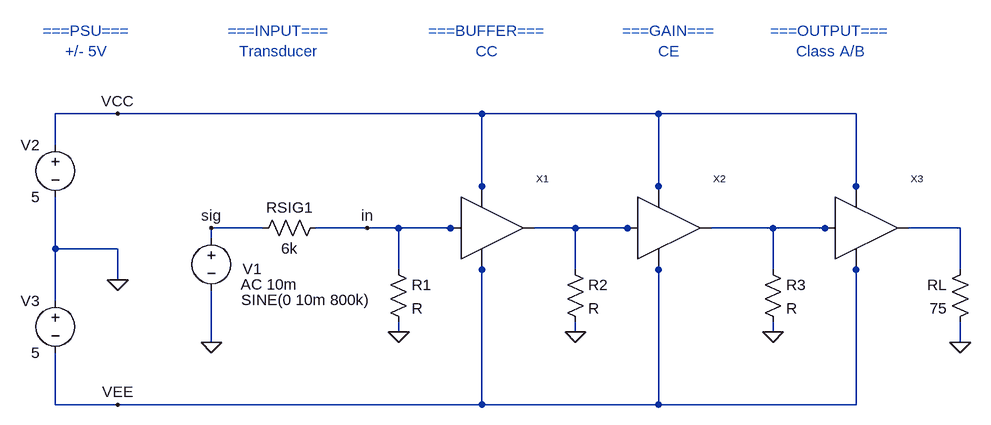
[diagram p0: schematic Lab 7 Amplifer Blocks.asc]
Lab 7 Amplifer Blocks.asc, the LTspice schematic file:
Version 4.1
SHEET 1 1372 680
WIRE -800 80 -896 80
WIRE -240 80 -800 80
WIRE 32 80 -240 80
WIRE 336 80 32 80
WIRE -896 128 -896 80
WIRE -240 192 -240 80
WIRE 32 192 32 80
WIRE 336 192 336 80
WIRE -576 256 -656 256
WIRE -416 256 -496 256
WIRE -368 256 -416 256
WIRE -288 256 -368 256
WIRE -96 256 -160 256
WIRE -16 256 -96 256
WIRE 208 256 112 256
WIRE 288 256 208 256
WIRE 496 256 416 256
WIRE -656 272 -656 256
WIRE -896 288 -896 208
WIRE -800 288 -896 288
WIRE -368 320 -368 256
WIRE -96 320 -96 256
WIRE 208 320 208 256
WIRE 496 320 496 256
WIRE -800 336 -800 288
WIRE -896 368 -896 288
WIRE -368 416 -368 400
WIRE -96 416 -96 400
WIRE 208 416 208 400
WIRE -656 432 -656 352
WIRE 496 432 496 400
WIRE -896 528 -896 448
WIRE -800 528 -896 528
WIRE -240 528 -240 320
WIRE -240 528 -800 528
WIRE 32 528 32 320
WIRE 32 528 -240 528
WIRE 336 528 336 320
WIRE 336 528 32 528
FLAG -656 432 0
FLAG -656 256 sig
FLAG -416 256 in
FLAG -368 416 0
FLAG -96 416 0
FLAG 208 416 0
FLAG 496 432 0
FLAG -800 336 0
FLAG -800 528 VEE
FLAG -800 80 VCC
SYMBOL voltage -656 256 R0
WINDOW 0 48 63 Left 2
WINDOW 3 46 111 Left 2
WINDOW 123 45 87 Left 2
WINDOW 39 0 0 Left 0
SYMATTR InstName V1
SYMATTR Value SINE(0 10m 800k)
SYMATTR Value2 AC 10m
SYMBOL res -480 240 R90
WINDOW 0 0 56 VBottom 2
WINDOW 3 32 56 VTop 2
SYMATTR InstName RSIG1
SYMATTR Value 6k
SYMBOL res -384 304 R0
SYMATTR InstName R1
SYMBOL Ideal\ Amp -272 256 R0
SYMATTR InstName X1
SYMBOL res -112 304 R0
SYMATTR InstName R2
SYMBOL Ideal\ Amp 0 256 R0
SYMATTR InstName X2
SYMBOL res 192 304 R0
SYMATTR InstName R3
SYMBOL Ideal\ Amp 304 256 R0
SYMATTR InstName X3
SYMBOL res 512 304 M0
SYMATTR InstName RL
SYMATTR Value 75
SYMBOL voltage -896 112 M0
WINDOW 123 0 0 Left 0
WINDOW 39 0 0 Left 0
SYMATTR InstName V2
SYMATTR Value 5
SYMBOL voltage -896 352 M0
WINDOW 123 0 0 Left 0
WINDOW 39 0 0 Left 0
SYMATTR InstName V3
SYMATTR Value 5
TEXT 296 -32 Center 2 ;===OUTPUT===\nClass A/B
TEXT 48 -32 Center 2 ;===GAIN===\nCE
TEXT -232 -32 Center 2 ;===BUFFER===\nCC
TEXT -552 -32 Center 2 ;===INPUT===\nTransducer
TEXT -848 -32 Center 2 ;===PSU===\n+/- 5V

The netlist it stands for:
* Lab 7 Amplifer Blocks.asc
V1 sig 0 SINE(0 10m 800k) AC 10m
RSIG1 in sig 6k
R1 in 0 R
X§X1 in in N001 VCC VCC VEE VEE Ideal Amp
R2 N001 0 R
X§X2 N001 N001 N002 VCC VCC VEE VEE Ideal Amp
R3 N002 0 R
X§X3 N002 N002 N003 VCC VCC VEE VEE Ideal Amp
RL N003 0 75
V2 VCC 0 5
V3 0 VEE 5
* ===OUTPUT===
* Class A/B
* ===GAIN===
* CE
* ===BUFFER===
* CC
* ===INPUT===
* Transducer
* ===PSU===
* +/- 5V
.backanno
.end